# Altium schematic sheet Main.SchDoc
size A; SheetNumber: 1; SheetTotal: 7
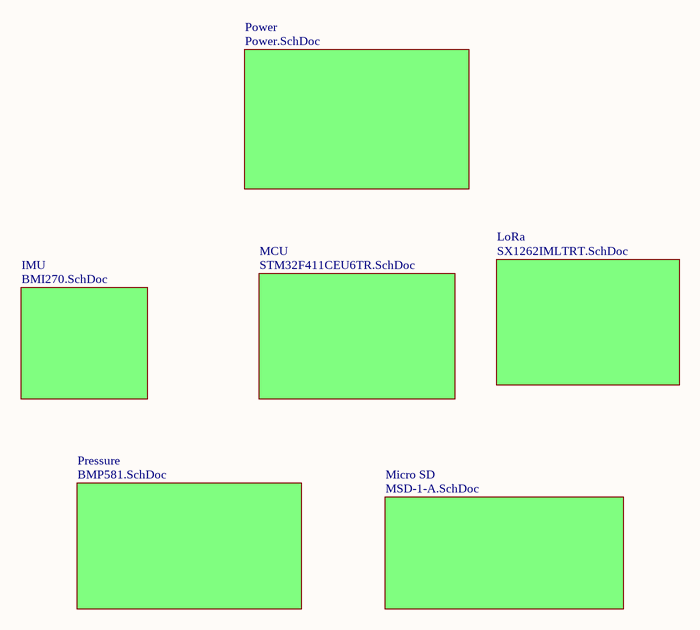
[diagram p0: Main.SchDoc]

## Sub-sheets
IMU = BMI270.SchDoc: no entries
LoRa = SX1262IMLTRT.SchDoc: no entries
MCU = STM32F411CEU6TR.SchDoc: no entries
Micro SD = MSD-1-A.SchDoc: no entries
Power = Power.SchDoc: no entries
Pressure = BMP581.SchDoc: no entries